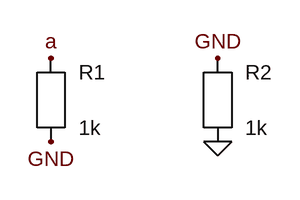
[diagram p0: schematic gnd_label.asc]
gnd_label.asc, the LTspice schematic file:
Version 4
SHEET 1 880 680
FLAG 96 96 a
FLAG 96 192 GND
FLAG 288 96 GND
FLAG 288 192 0
SYMBOL res 96 144 R0
SYMATTR InstName R1
SYMATTR Value 1k
SYMBOL res 288 144 R0
SYMATTR InstName R2
SYMATTR Value 1k

The netlist it stands for:
* gnd_label.asc
R1 a GND 1k
R2 GND 0 1k
.backanno
.end